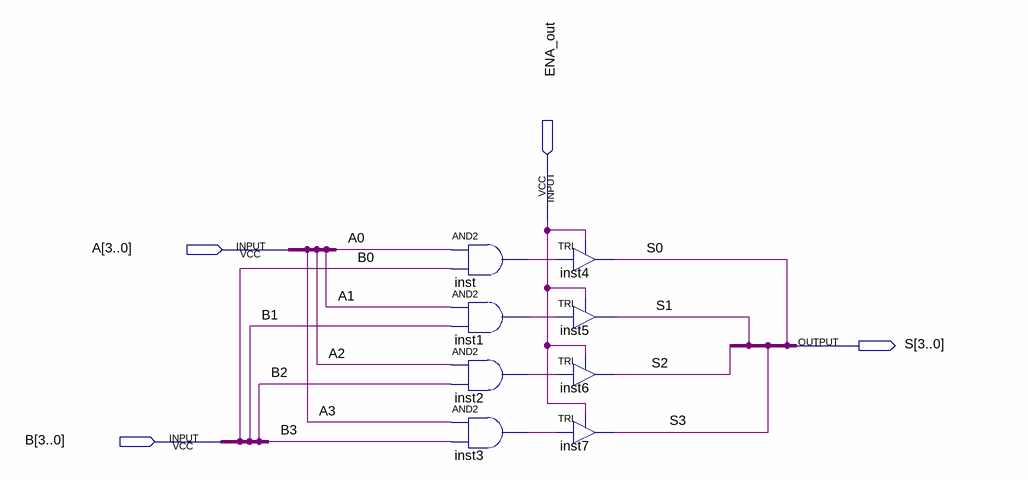
[diagram p0: schematic sheet]
// Quartus schematic and-arr4.bdf as structural Verilog: 8 symbols, 4 pins
module \and-arr4  (
  input  ENA_out,
  input  [3:0] A,
  input  [3:0] B,
  output [3:0] S
);

  wire inst1_out, inst2_out, inst3_out, inst_out;

  and inst (inst_out, A[0], B[0]);
  and inst1 (inst1_out, A[1], B[1]);
  and inst2 (inst2_out, A[2], B[2]);
  and inst3 (inst3_out, A[3], B[3]);
  TRI inst4 (.IN(inst_out), .OE(ENA_out), .OUT(S[0]));
  TRI inst5 (.IN(inst1_out), .OE(ENA_out), .OUT(S[1]));
  TRI inst6 (.IN(inst2_out), .OE(ENA_out), .OUT(S[2]));
  TRI inst7 (.IN(inst3_out), .OE(ENA_out), .OUT(S[3]));
endmodule
